# Altium schematic sheet Top_Sheet.SchDoc
size A4; SheetNumber: 1; SheetTotal: 5
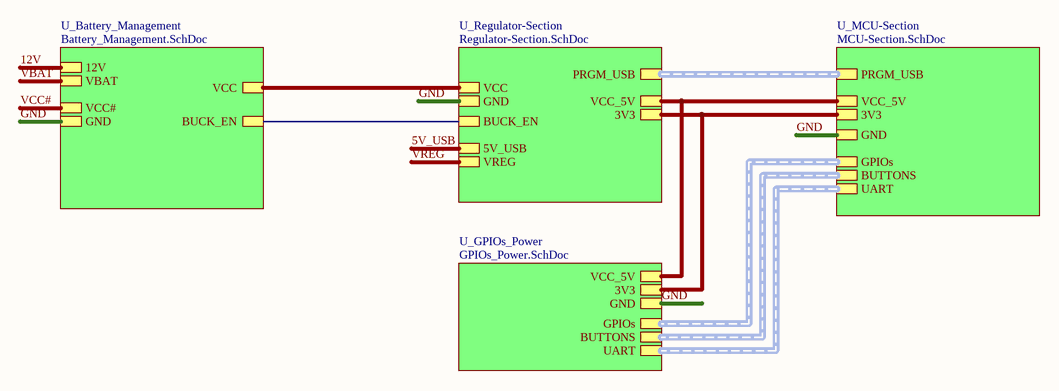
[diagram p0: Top_Sheet.SchDoc]

## Sub-sheets
U_Battery_Management = Battery_Management.SchDoc: BUCK_EN, GND, VCC#, VCC, VBAT, 12V
U_GPIOs_Power = GPIOs_Power.SchDoc: 3V3, GND, VCC_5V, GPIOs (harness GPIOs), BUTTONS (harness BUTTONS), UART (harness UART)
U_MCU-Section = MCU-Section.SchDoc: 3V3, GND, VCC_5V, PRGM_USB (harness PRGM_USB), GPIOs (harness GPIOs), BUTTONS (harness BUTTONS), UART (harness UART)
U_Regulator-Section = Regulator-Section.SchDoc: BUCK_EN, 3V3, GND, VCC_5V, VCC, 5V_USB, VREG, PRGM_USB (harness PRGM_USB)

## Nets
5V_USB: sheet U_Regulator-Section/5V_USB
12V: sheet U_Battery_Management/12V
GND: sheet U_Regulator-Section/GND, sheet U_Battery_Management/GND, sheet U_MCU-Section/GND, sheet U_GPIOs_Power/GND
VBAT: sheet U_Battery_Management/VBAT
VCC#: sheet U_Battery_Management/VCC#
VREG: sheet U_Regulator-Section/VREG
(unnamed): sheet U_Regulator-Section/BUCK_EN, sheet U_Battery_Management/BUCK_EN
(unnamed): sheet U_Regulator-Section/3V3, sheet U_MCU-Section/3V3, sheet U_GPIOs_Power/3V3
(unnamed): sheet U_Regulator-Section/VCC_5V, sheet U_MCU-Section/VCC_5V, sheet U_GPIOs_Power/VCC_5V
(unnamed): sheet U_Regulator-Section/VCC, sheet U_Battery_Management/VCC

## Buses and harness runs
harness sheet U_GPIOs_Power/BUTTONS = sheet U_MCU-Section/BUTTONS
harness sheet U_GPIOs_Power/GPIOs = sheet U_MCU-Section/GPIOs
harness sheet U_GPIOs_Power/UART = sheet U_MCU-Section/UART
harness sheet U_MCU-Section/PRGM_USB = sheet U_Regulator-Section/PRGM_USB

## Notes on the sheet
- File:
- Title:
- Date:
- Page
- Num:
- Total:
- Drawn By: Huzaifa Ali